# Altium schematic sheet signal-light-13.SchDoc
size A4; SheetNumber: 16; SheetTotal: 21
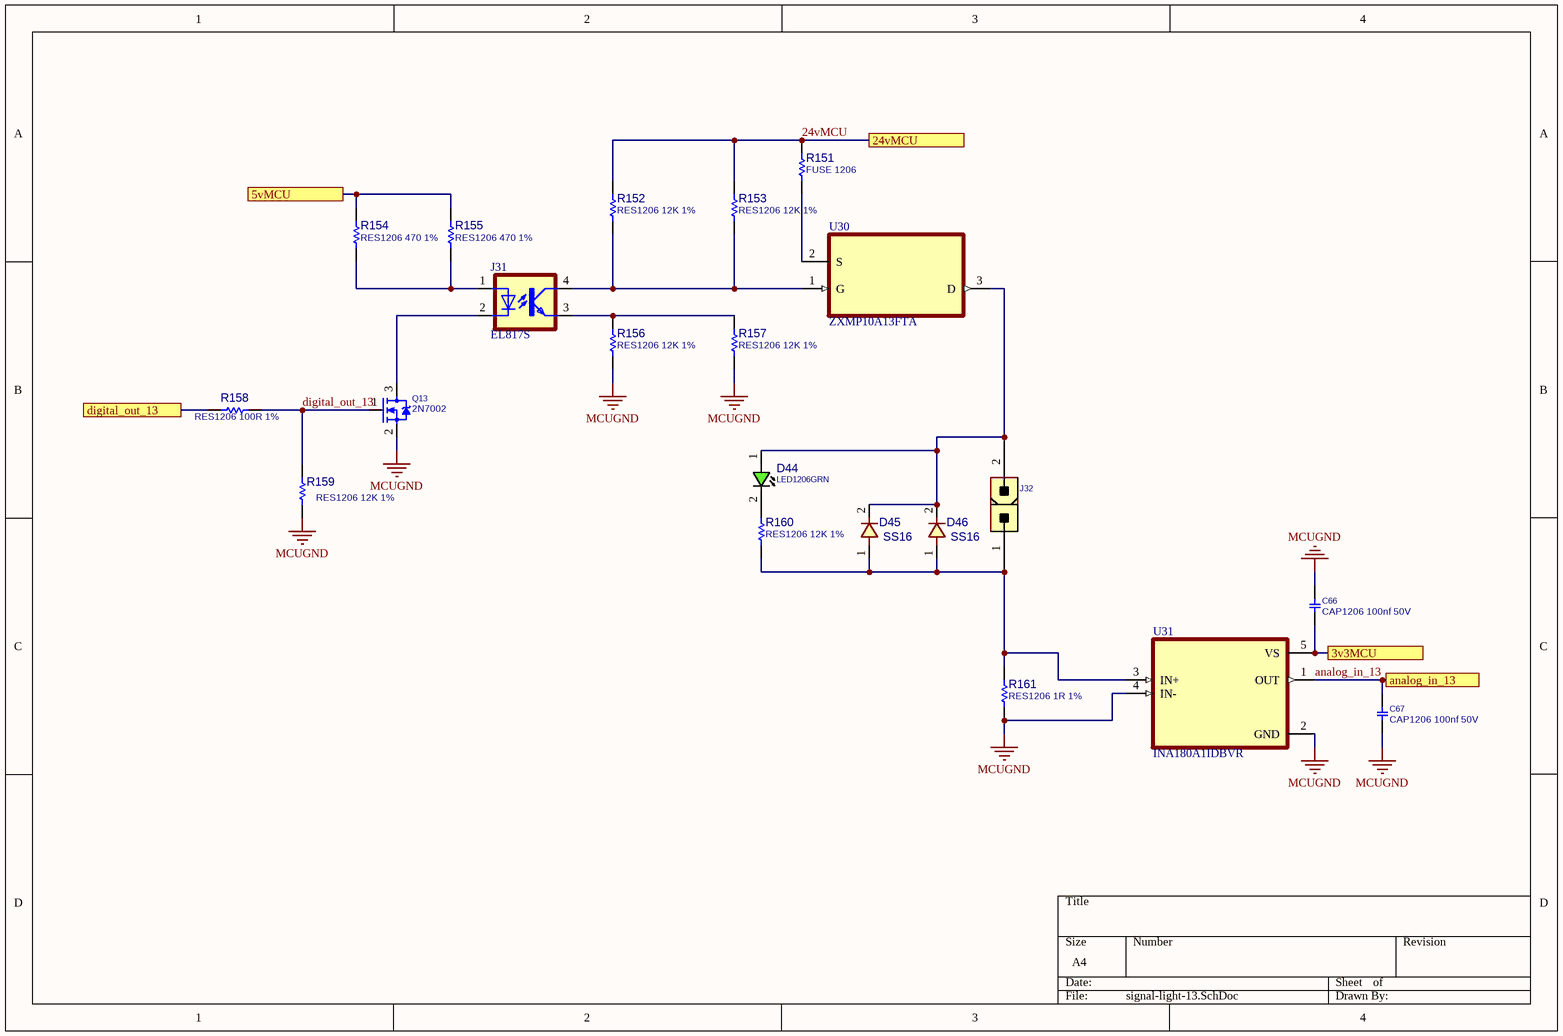
[diagram p0: signal-light-13.SchDoc]

## Parts
C66  CAP1206 100nf 50V  [C1206]
C67  CAP1206 100nf 50V  [C1206]
D44  LED1206GRN  [LED1206GRN]
D45  SS16  [D_SMA]
D46  SS16  [D_SMA]
J31  EL817S  [SOIC254P1030X460-4N]
J32  CONN_ATXPWR_2  [ATXPWR_2]  (value not drawn)
Q13  2N7002  [SOT23_3]
R151  FUSE 1206  [R1206]
R152  RES1206 12K 1%  [R1206]
R153  RES1206 12K 1%  [R1206]
R154  RES1206 470 1%  [R1206]
R155  RES1206 470 1%  [R1206]
R156  RES1206 12K 1%  [R1206]
R157  RES1206 12K 1%  [R1206]
R158  RES1206 100R 1%  [R1206]
R159  RES1206 12K 1%  [R1206]
R160  RES1206 12K 1%  [R1206]
R161  RES1206 1R 1%  [R1206]
U30  ZXMP10A13FTA  [SOT95P230X110-3N]
U31  INA180A1IDBVR  [SOT95P280X145-5N]

## Ports
3v3MCU, 5vMCU, 24vMCU, analog_in_13, digital_out_13

## Nets
MCUGND: C66.1 C67.2 Q13.2(SOURCE) R156.2 R157.2 R159.2 R161.2 U31.2(GND) U31.4(IN-)
3v3MCU: C66.2 U31.5(VS) ; port 3v3MCU
5vMCU: R154.2 R155.2 ; port 5vMCU
24vMCU: R151.1 R152.1 R153.1 ; port 24vMCU
analog_in_13: C67.1 U31.1(OUT) ; port analog_in_13
digital_out_13: Q13.1(GATE) R158.2 R159.1
digital_out_13: R158.1 ; port digital_out_13  [a separate net that carries the same name]
NetD44_1: D44.1(ANODE) D45.2 D46.2 J32.2 U30.3(D)
NetD44_2: D44.2(CATHODE) R160.1
NetD45_1: D45.1 D46.1 J32.1 R160.2 R161.1 U31.3(IN+)
NetJ31_1: J31.1(A) R154.1 R155.1
NetJ31_2: J31.2(C) Q13.3(DRAIN)
NetJ31_3: J31.3(EMIT) R156.1 R157.1
NetJ31_4: J31.4(COL) R152.2 R153.2 U30.1(G)
NetR151_2: R151.2 U30.2(S)

## Library data of the parts
C66 C67 = CAP_SMD_MLCC_1206: CAP, MLCC; PARAM: -, -%; MANF_P#: MANF_PART#; PARAM2: -V; PRICE: 100= 1$; MANF: -; ASSEMBLY: ASSEMBLY
D44 = LED_SMD_1206_GRN: LED, SMD, 1206, GREEN; PARAM: 20mA; DESC: DESCRIPTION; PARAM2: 2.2V; MANF: -; ASSEMBLY: ASSEMBLY; PRICE: 36t@Javan; MANF_P#: -; VALUE: LED1206GRN; MountType: SMT; PartType: LED
D45 D46 = DIODE_SMD_1N4001: DIODE, GENERAL PURPOSE, 50V/1A; DESC: DESCRIPTION; PARAM: 50V VRRM; PARAM2: 1A; MANF_P#: 1N4001; MANF: MANF; ASSEMBLY: ASSEMBLY; PRICE: PRICE; VALUE: SS16
J31 = EL817S: Optoisolator Transistor Output 5000Vrms 1 Channel 4-SMD; MF: Everlight Electronics; SnapEDA_Link: https://www.snapeda.com/parts/EL817S/Everlight+Electronics+Co+Ltd/view-part/?ref=snap; Package: SMD-4 Everlight Electronics Co Ltd; Value: *; MP: EL817S; Check_prices: https://www.snapeda.com/parts/EL817S/Everlight+Electronics+Co+Ltd/view-part/?ref=eda
J32 = CONN_ATXPWR_2: CONN, ATX POWER, 2 P; MANF: Molex; MANF_P#: 39281023; VALUE: CONN_ATXPWR_2; MountType: THD; PACKAGE: ATXPWR-2pin; Part Type: Conn.
Q13 = MOSN_2N7002_SOT23: MOSFET, N-CH, 60V, 0.3A; MANF: NXP; ASSEMBLY: ASSEMBLY; MANF_P#: 2N7002; PARAM2: 60v; PARAM: 0.3A; PRICE: 0.3t@Javan; VALUE: 2N7002
R151-R161 = RES_SMD_1206: RESISTOR, SMD; PARAM: 1%, 0.25W; DESC: DESCRIPTION; DIST#: MOUSER; MANF_P#: -; MANF: -; ASSEMBLY: ASSEMBLY; PRICE: -; PARAM2: -
U30 = ZXMP10A13FTA: P-Channel 100 V 600mA (Ta) 625mW (Ta) Surface Mount SOT-23-3; MF: Diodes Inc.; Purchase-URL: https://pricing.snapeda.com/search/part/ZXMP10A13FTA/?ref=eda; Package: SOT-23-3 Diodes Inc.; SnapEDA_Link: https://www.snapeda.com/parts/ZXMP10A13FTA/Diodes+Inc./view-part/?ref=snap; Availability: In Stock; Value: *; MP: ZXMP10A13FTA; Check_prices: https://www.snapeda.com/parts/ZXMP10A13FTA/Diodes+Inc./view-part/?ref=eda; Price: None
U31 = INA180A1IDBVR: 26V, 350kHz current sense amplifier; MF: Texas Instruments; SnapEDA_Link: https://www.snapeda.com/parts/INA180A1IDBVR/Texas+Instruments/view-part/?ref=snap; Package: SOT-23-5 Texas Instruments; Value: *; MP: INA180A1IDBVR; Check_prices: https://www.snapeda.com/parts/INA180A1IDBVR/Texas+Instruments/view-part/?ref=eda